# EAGLE design SparkFun_TensorFlow_Ambiq_Apollo3 (EAGLE 9.4.0)

## Sheet 1 of 2
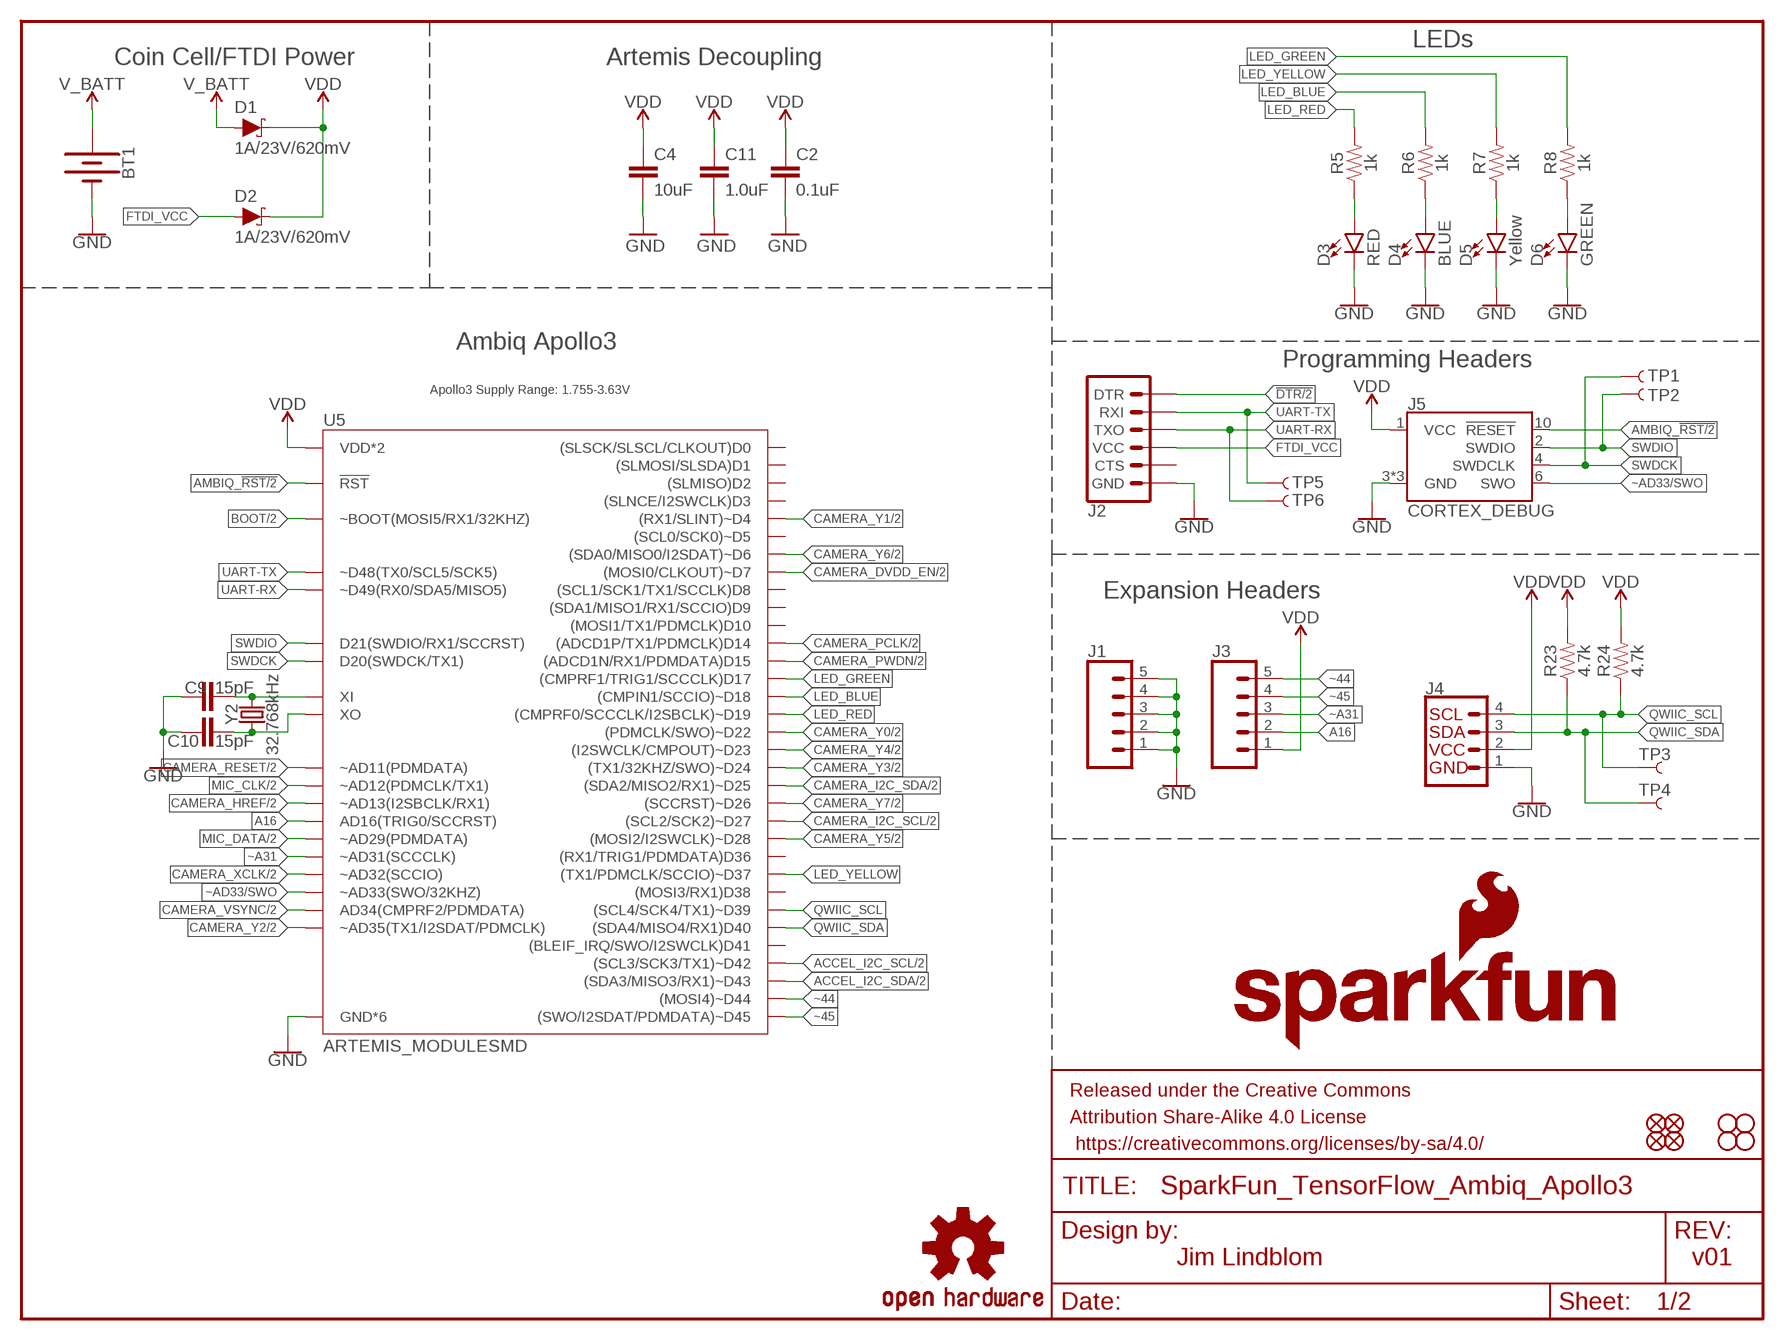
[diagram p0: schematic, sheet 1]

### Parts
BT1  BATTERY-20MM_SMD_4LEGS_OVERPASTE_INNER  [BATTCON_20MM_4LEGS_OVERPASTE_INNER]
C2  0.1uF  0.1UF-0402T-16V-10%  [0402-TIGHT]
C4  10uF  10UF-0603-6.3V-20%  [0603]
C9  15pF  15PF-0402-TIGHT-50V-5%  [0402-TIGHT]
C10  15pF  15PF-0402-TIGHT-50V-5%  [0402-TIGHT]
C11  1.0uF  1.0UF-0402T-16V-10%  [0402-TIGHT]
D1  1A/23V/620mV  DIODE-SCHOTTKY-BAT20J  [SOD-323]
D2  1A/23V/620mV  DIODE-SCHOTTKY-BAT20J  [SOD-323]
D3  RED  LED-RED0603  [LED-0603]
D4  BLUE  LED-BLUE0603  [LED-0603]
D5  Yellow  LED-YELLOW0603  [LED-0603]
D6  GREEN  LED-GREEN0603  [LED-0603]
FD1  FIDUCIAL1X2  [FIDUCIAL-1X2]
FD2  FIDUCIAL1X2  [FIDUCIAL-1X2]
FD3  FIDUCIAL1X2  [FIDUCIAL-1X2]
FD4  FIDUCIAL1X2  [FIDUCIAL-1X2]
FRAME1  FRAME-LETTER  [CREATIVE_COMMONS]
H1  STAND-OFF  [STAND-OFF]
H2  STAND-OFF  [STAND-OFF]
H3  STAND-OFF  [STAND-OFF]
H4  STAND-OFF  [STAND-OFF]
J1  CONN_05NO_SILK  [1X05_NO_SILK]
J2  6_PIN_SERIAL_TARGETSMD  [1X06-SMD_RA_MALE]
J3  CONN_05NO_SILK  [1X05_NO_SILK]
J4  QWIIC_CONNECTORJS-1MM  [JST04_1MM_RA]
J5  CORTEX_DEBUG  CORTEX_DEBUG_MINIMUM_PTH_NS  [2X5-PTH-1.27MM-NO_SILK]
LOGO1  SFE_LOGO_NAME_FLAME.1_INCH  [SFE_LOGO_NAME_FLAME_.1]
LOGO2  OSHW-LOGOS  [OSHW-LOGO-S]
R5  1k  1KOHM-0603-1/10W-1%  [0603]
R6  1k  1KOHM-0603-1/10W-1%  [0603]
R7  1k  1KOHM-0603-1/10W-1%  [0603]
R8  1k  1KOHM-0603-1/10W-1%  [0603]
R23  4.7k  4.7KOHM-0603-1/10W-1%  [0603]
R24  4.7k  4.7KOHM-0603-1/10W-1%  [0603]
TP1  TEST-POINT3X5  [PAD.03X.05]
TP2  TEST-POINT3X5  [PAD.03X.05]
TP3  TEST-POINT3X5  [PAD.03X.05]
TP4  TEST-POINT3X5  [PAD.03X.05]
TP5  TEST-POINT3X5  [PAD.03X.05]
TP6  TEST-POINT3X5  [PAD.03X.05]
U5  ARTEMIS_MODULESMD  [ARTEMIS_FP]
Y2  32.768kHz  CRYSTAL-32.768KHZSMD-3.2X1.5  [CRYSTAL-SMD-3.2X1.5MM]

### Nets
!DTR: J2.1(DTR) ; also sheet 2
A16: J3.2 U5.AD16(AD16(TRIG0/SCCRST))
ACCEL_I2C_SCL: U5.~D42((SCL3/SCK3/TX1)~D42) ; also sheet 2
ACCEL_I2C_SDA: U5.~D43((SDA3/MISO3/RX1)~D43) ; also sheet 2
AMBIQ_!RST: J5.10(!RESET) U5.~RST(!RST) ; also sheet 2
BOOT: U5.BOOT(~BOOT(MOSI5/RX1/32KHZ)) ; also sheet 2
CAMERA_DVDD_EN: U5.D7((MOSI0/CLKOUT)~D7) ; also sheet 2
CAMERA_HREF: U5.~AD13(~AD13(I2SBCLK/RX1)) ; also sheet 2
CAMERA_I2C_SCL: U5.~D27((SCL2/SCK2)~D27) ; also sheet 2
CAMERA_I2C_SDA: U5.~D25((SDA2/MISO2/RX1)~D25) ; also sheet 2
CAMERA_PCLK: U5.D14((ADCD1P/TX1/PDMCLK)D14) ; also sheet 2
CAMERA_PWDN: U5.D15((ADCD1N/RX1/PDMDATA)D15) ; also sheet 2
CAMERA_RESET: U5.~AD11(~AD11(PDMDATA)) ; also sheet 2
CAMERA_VSYNC: U5.AD34(AD34(CMPRF2/PDMDATA)) ; also sheet 2
CAMERA_XCLK: U5.~AD32(~AD32(SCCIO)) ; also sheet 2
CAMERA_Y0: U5.~D22((PDMCLK/SWO)~D22) ; also sheet 2
CAMERA_Y1: U5.~D4((RX1/SLINT)~D4) ; also sheet 2
CAMERA_Y2: U5.~AD35(~AD35(TX1/I2SDAT/PDMCLK)) ; also sheet 2
CAMERA_Y3: U5.~D24((TX1/32KHZ/SWO)~D24) ; also sheet 2
CAMERA_Y4: U5.~D23((I2SWCLK/CMPOUT)~D23) ; also sheet 2
CAMERA_Y5: U5.~D28((MOSI2/I2SWCLK)~D28) ; also sheet 2
CAMERA_Y6: U5.~D6((SDA0/MISO0/I2SDAT)~D6) ; also sheet 2
CAMERA_Y7: U5.~D26((SCCRST)~D26) ; also sheet 2
FTDI_VCC: D2.A J2.4(VCC)
GND: BT1.2(-) C2.1 C4.2 C9.1 C10.1 C11.2 D3.C D4.C D5.C D6.C J1.1 J1.2 J1.3 J1.4 J1.5 J2.6(GND) J4.1 J5.3(GND) J5.5(GND) J5.9(GND) U5.GND@1(GND*6) U5.GND@22(GND*6) U5.GND@38(GND*6) U5.GND@39(GND*6) U5.GND@47(GND*6) U5.GND@59(GND*6) ; also sheet 2
LED_BLUE: R6.2 U5.~D18((CMPIN1/SCCIO)~D18)
LED_GREEN: R8.2 U5.D17((CMPRF1/TRIG1/SCCCLK)D17)
LED_RED: R5.2 U5.~D19((CMPRF0/SCCCLK/I2SBCLK)~D19)
LED_YELLOW: R7.2 U5.~D37((TX1/PDMCLK/SCCIO)~D37)
MIC_CLK: U5.~AD12(~AD12(PDMCLK/TX1)) ; also sheet 2
MIC_DATA: U5.~AD29(~AD29(PDMDATA)) ; also sheet 2
N$2: C9.2 U5.XI Y2.P$2
N$5: D4.A R6.1
N$6: D3.A R5.1
N$7: D5.A R7.1
N$8: D6.A R8.1
QWIIC_SCL: J4.4 R24.1 TP3.P$1 U5.~D39((SCL4/SCK4/TX1)~D39)
QWIIC_SDA: J4.3 R23.1 TP4.P$1 U5.D40((SDA4/MISO4/RX1)D40)
SWDCK: J5.4(SWDCLK) TP1.P$1 U5.SWDCK(D20(SWDCK/TX1))
SWDIO: J5.2(SWDIO) TP2.P$1 U5.SWDIO(D21(SWDIO/RX1/SCCRST))
UART-RX: J2.3(TXO) TP6.P$1 U5.RXI-0(~D49(RX0/SDA5/MISO5))
UART-TX: J2.2(RXI) TP5.P$1 U5.TXO-0(~D48(TX0/SCL5/SCK5))
V_BATT: BT1.1(+) D1.A
VDD: C2.2 C4.1 C11.1 D1.C D2.C J3.1 J4.2 J5.1(VCC) R23.2 R24.2 U5.VDD@36(VDD*2) U5.VDD@37(VDD*2) ; also sheet 2
X0: C10.2 U5.XO Y2.P$1
~44: J3.5 U5.~D44((MOSI4)~D44)
~45: J3.4 U5.~D45((SWO/I2SDAT/PDMDATA)~D45)
~A31: J3.3 U5.~AD31(~AD31(SCCCLK))
~AD33/SWO: J5.6(SWO) U5.~AD33/SWO(~AD33(SWO/32KHZ))
Unconnected: J2.5(CTS) U5.D0((SLSCK/SLSCL/CLKOUT)D0) U5.D1((SLMOSI/SLSDA)D1) U5.D2((SLMISO)D2) U5.D3((SLNCE/I2SWCLK)D3) U5.D8((SCL1/SCK1/TX1/SCCLK)D8) U5.D9((SDA1/MISO1/RX1/SCCIO)D9) U5.D10((MOSI1/TX1/PDMCLK)D10) U5.D36((RX1/TRIG1/PDMDATA)D36) U5.D38((MOSI3/RX1)D38) U5.D41((BLEIF_IRQ/SWO/I2SWCLK)D41) U5.~D5((SCL0/SCK0)~D5)

### Notes on the sheet
- LEDs
- Coin Cell/FTDI Power | Artemis Decoupling
- Ambiq Apollo3
- Programming Headers
- Apollo3 Supply Range: 1.755-3.63V
- Expansion Headers
- Jim Lindblom | v01

## Sheet 2 of 2
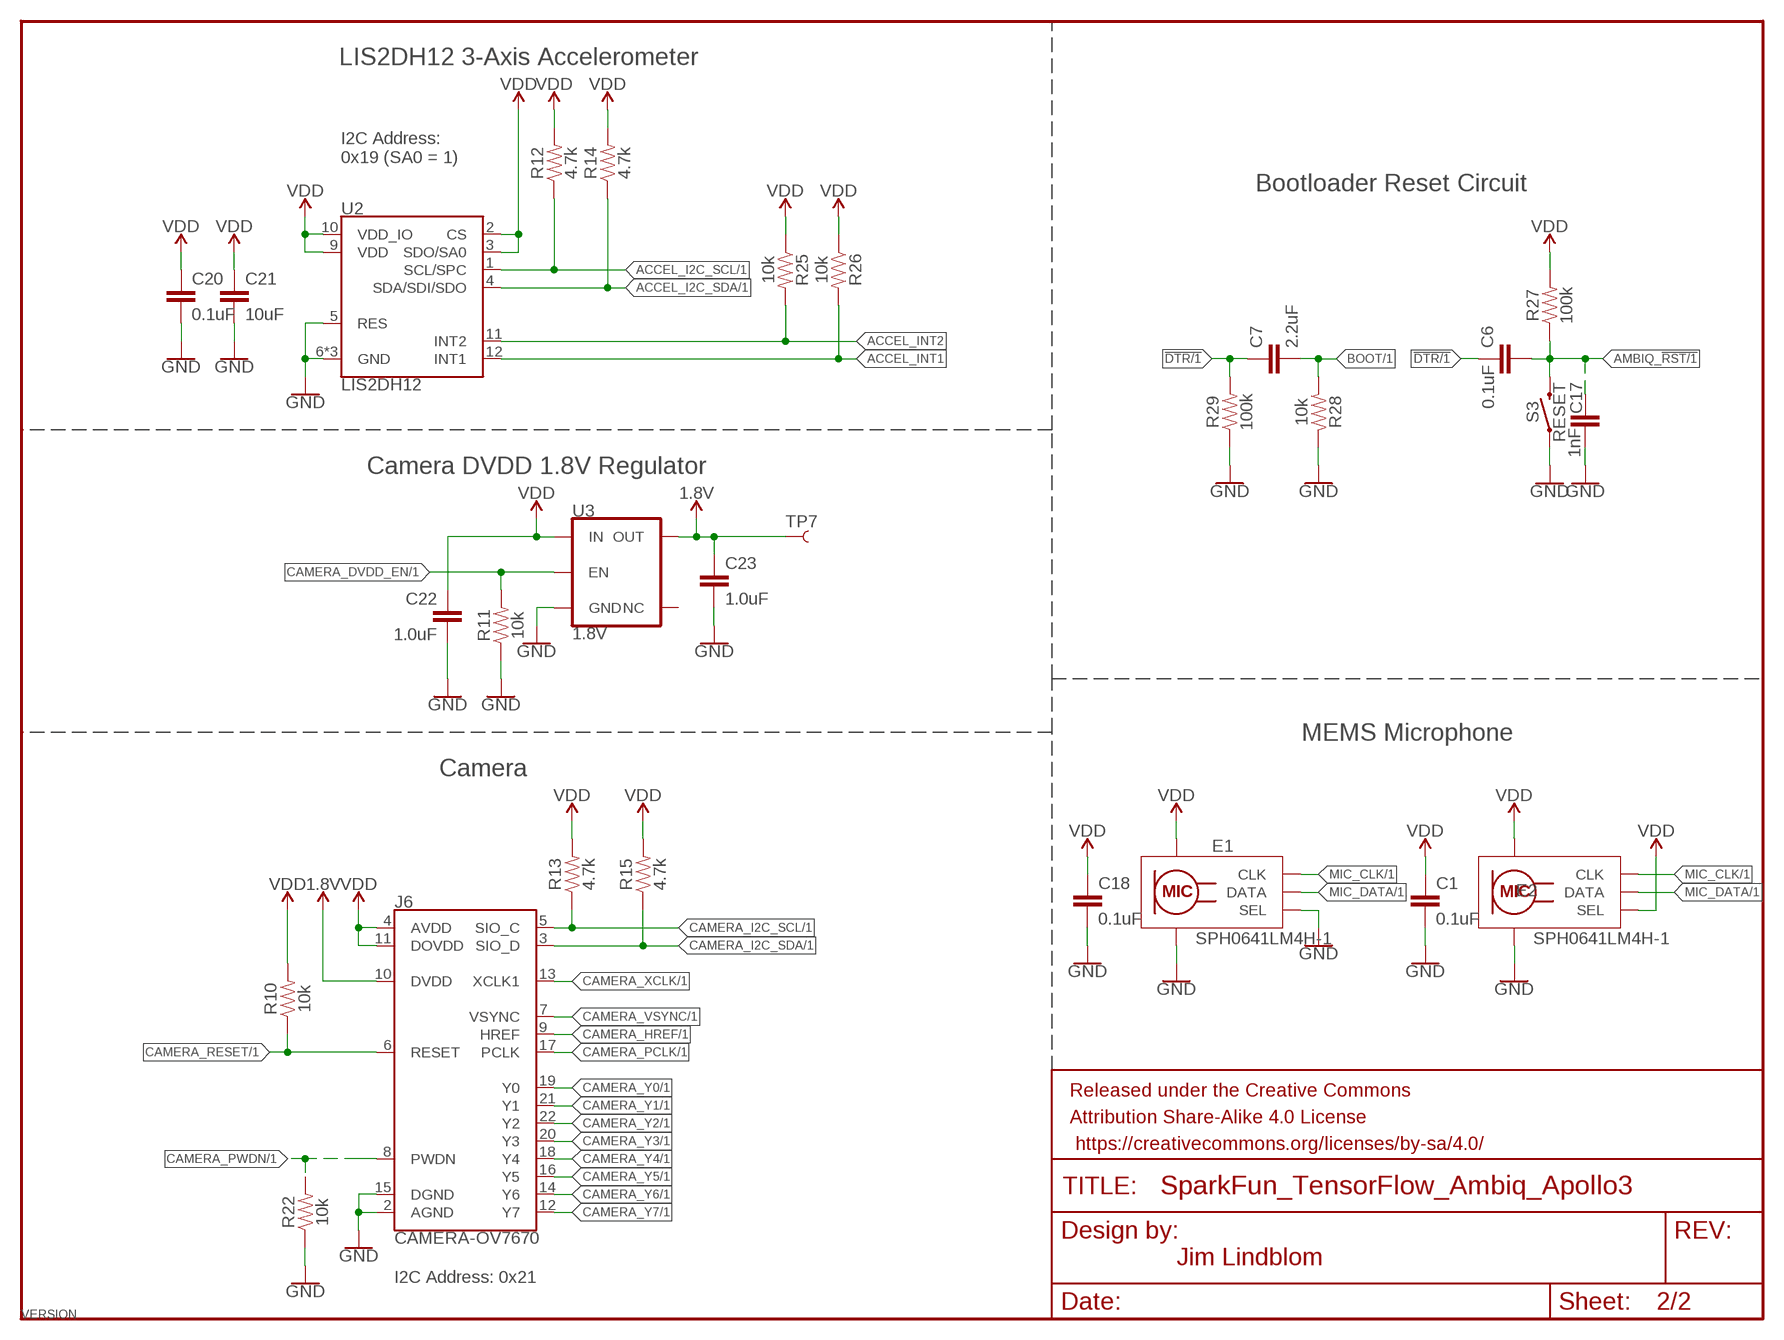
[diagram p1: schematic, sheet 2]

### Parts
C1  0.1uF  0.1UF-0402-TIGHT-16V-10%  [0402-TIGHT]
C6  0.1uF  0.1UF-0603-25V-5%  [0603]
C7  2.2uF  2.2UF-0603-10V-20%  [0603]
C17  1nF  1.0NF/1000PF-0603-50V-10%  [0603]
C18  0.1uF  0.1UF-0402-TIGHT-16V-10%  [0402-TIGHT]
C20  0.1uF  0.1UF-0402-TIGHT-16V-10%  [0402-TIGHT]
C21  10uF  10UF-0603-6.3V-20%  [0603]
C22  1.0uF  1.0UF-0402-TIGHT-16V-10%  [0402-TIGHT]
C23  1.0uF  1.0UF-0402-TIGHT-16V-10%  [0402-TIGHT]
E1  SPH0641LM4H-1  SPH0641LM4H-1_MICROPHONE  [SPH0641LM4H-1_MICROPHONE]
E2  SPH0641LM4H-1  SPH0641LM4H-1_MICROPHONE  [SPH0641LM4H-1_MICROPHONE]
FRAME2  FRAME-LETTERNO_PACKAGE  [DUMMY]
J6  CAMERA-OV7670  [FPC-24-AMPHENOL-SFV24R-1STE1HLF]
R10  10k  10KOHM-0402T-1/16W-1%  [0402-TIGHT]
R11  10k  10KOHM-0402T-1/16W-1%  [0402-TIGHT]
R12  4.7k  4.7KOHM-0603-1/10W-1%  [0603]
R13  4.7k  4.7KOHM-0603-1/10W-1%  [0603]
R14  4.7k  4.7KOHM-0603-1/10W-1%  [0603]
R15  4.7k  4.7KOHM-0603-1/10W-1%  [0603]
R22  10k  10KOHM-0402T-1/16W-1%  [0402-TIGHT]
R25  10k  10KOHM-0402T-1/16W-1%  [0402-TIGHT]
R26  10k  10KOHM-0402T-1/16W-1%  [0402-TIGHT]
R27  100k  100KOHM-0603-1/10W-1%  [0603]
R28  10k  10KOHM-0603-1/10W-1%  [0603]
R29  100k  100KOHM-0603-1/10W-1%  [0603]
S3  RESET  MOMENTARY-SWITCH-SPST-SMD-5.2MM-TALL  [TACTILE_SWITCH_SMD_5.2MM]
TP7  TEST-POINT3X5  [PAD.03X.05]
U2  LIS2DH12  [LGA-12-LISDH12]
U3  1.8V  V_REG_AP2127K-1.8V  [SOT23-5]

### Nets
1.8V: C23.1 J6.10(DVDD) TP7.P$1 U3.5(OUT)
!DTR: C6.1 C7.1 R29.2 ; also sheet 1
ACCEL_I2C_SCL: R12.1 U2.1(SCL/SPC) ; also sheet 1
ACCEL_I2C_SDA: R14.1 U2.4(SDA/SDI/SDO) ; also sheet 1
ACCEL_INT1: R26.2 U2.12(INT1)
ACCEL_INT2: R25.2 U2.11(INT2)
AMBIQ_!RST: C6.2 C17.1 R27.1 S3.3 ; also sheet 1
BOOT: C7.2 R28.2 ; also sheet 1
CAMERA_DVDD_EN: R11.2 U3.3(EN) ; also sheet 1
CAMERA_HREF: J6.9(HREF) ; also sheet 1
CAMERA_I2C_SCL: J6.5(SIO_C) R13.1 ; also sheet 1
CAMERA_I2C_SDA: J6.3(SIO_D) R15.1 ; also sheet 1
CAMERA_PCLK: J6.17(PCLK) ; also sheet 1
CAMERA_PWDN: J6.8(PWDN) R22.2 ; also sheet 1
CAMERA_RESET: J6.6(RESET) R10.1 ; also sheet 1
CAMERA_VSYNC: J6.7(VSYNC) ; also sheet 1
CAMERA_XCLK: J6.13(XCLK1) ; also sheet 1
CAMERA_Y0: J6.19(Y0) ; also sheet 1
CAMERA_Y1: J6.21(Y1) ; also sheet 1
CAMERA_Y2: J6.22(Y2) ; also sheet 1
CAMERA_Y3: J6.20(Y3) ; also sheet 1
CAMERA_Y4: J6.18(Y4) ; also sheet 1
CAMERA_Y5: J6.16(Y5) ; also sheet 1
CAMERA_Y6: J6.14(Y6) ; also sheet 1
CAMERA_Y7: J6.12(Y7) ; also sheet 1
GND: C1.2 C17.2 C18.2 C20.2 C21.2 C22.2 C23.2 E1.2(SEL) E1.3(GND) E1.6(GND) E1.7(GND) E1.8(GND) E2.3(GND) E2.6(GND) E2.7(GND) E2.8(GND) J6.2(AGND) J6.15(DGND) R11.1 R22.1 R28.1 R29.1 S3.1 U2.5(RES) U2.6(GND) U2.7(GND) U2.8(GND) U3.2(GND) ; also sheet 1
MIC_CLK: E1.4(CLK) E2.4(CLK) ; also sheet 1
MIC_DATA: E1.1(DATA) E2.1(DATA) ; also sheet 1
VDD: C1.1 C18.1 C20.1 C21.1 C22.1 E1.5(VDD) E2.2(SEL) E2.5(VDD) J6.4(AVDD) J6.11(DOVDD) R10.2 R12.2 R13.2 R14.2 R15.2 R25.1 R26.1 R27.2 U2.2(CS) U2.3(SDO/SA0) U2.9(VDD) U2.10(VDD_IO) U3.1(IN) ; also sheet 1
Unconnected: J6.MNT1@0(MNT1) J6.MNT1@1(MNT1) J6.MNT2@0(MNT2) J6.MNT2@1(MNT2) U3.4(NC)

### Notes on the sheet
- LIS2DH12 3-Axis Accelerometer
- I2C Address:
  0x19 (SA0 = 1)
- Bootloader Reset Circuit
- Camera DVDD 1.8V Regulator
- MEMS Microphone
- Camera
- Jim Lindblom
- I2C Address: 0x21

## Library data of the parts
BT1 = SparkFun-Batteries:BATTERY: Battery - Single Cell A variety of battery chemistries, sizes, and footprints. Device List: 20MM_PTH - Coin Cell Battery Holder - 20mm (PTH) <https://www.sparkfun.com/products/783> 20MM_PTH_KIT- Coin Cell battery Holder - 20 mm (PTH) <http://www.sparkfun.com/products/783>kit version with special mask 6.8MM_PTH - Coin Cell Battery Holder - 6.8MM(SMD) <https://www.digikey.com/product-detail/en/seiko-instruments/MS621FE-FL11E/728-1057-ND/1889208?WT.srch=1&gclid=CNOQ5a6LzdQCFZS2wAodXCkE0g> 12MM_SMD - Coin Cell Battery Holder - 12mm (SMD) <https://www.sparkfun.com/products/10592> 12MM_PTH - Coin Cell Battery Holder - 12mm (PTH) <https://www.sparkfun.com/products/7948> 20MM_SMD - 20mm Coin Cell Battery Holder (SMD) (2 legs) Used on the Big Time Watch Kit <https://www.sparkfun.com/products/11734> 20MM_SMD_4LEGS - Coin Cell Battery Holder - 20mm (SMD) <https://www.sparkfun.com/products/11892> 20MM_SMD_4LEGS_OVERPASTE - Coin Cell Battery Holder - 20mm (SMD) <https://www.sparkfun.com/products/11892> (Over-paste on the legs) 24.5MM_PTH - Coin Cell Battery Holder - 24.5mm (PTH) <https://www.sparkfun.com/products/8863> 9V - 9V Battery Holder - PC Mount Used on the SparkFun SparkPunk Sound Kit <https://www.sparkfun.com/products/11177> and SparkFun SparkPunk Sequencer Kit <https://www.sparkfun.com/products/12707> 18650 - Battery Holder - 18650 (PTH) <https://www.sparkfun.com/products/13113> AA - Battery Holder - 1xAA (PTH) <https://www.sparkfun.com/products/7949> AAA - Battery Holder - 1xAAA (PTH) <https://www.sparkfun.com/products/12718> AA_KIT - Battery Holder - 1xAA (PTH) <https://www.sparkfun.com/products/7949> Special kit package - pads only have exposed copper on one side of the board. AAA_KIT - Battery Holder - 1xAAA (PTH) <https://www.sparkfun.com/products/12718> Special kit package - pads only have exposed copper on one side of the board.
C1 C18 C20 = ambiq:0.1UF: 0.1µF ceramic capacitors A capacitor is a passive two-terminal electrical component used to store electrical energy temporarily in an electric field.; PROD_ID: CAP-12416
C2 = SparkFun-Capacitors:0.1UF: 0.1µF ceramic capacitors A capacitor is a passive two-terminal electrical component used to store electrical energy temporarily in an electric field.; PROD_ID: CAP-12416
C4 C21 = SparkFun-Capacitors:10UF: 10.0µF ceramic capacitors A capacitor is a passive two-terminal electrical component used to store electrical energy temporarily in an electric field.; PROD_ID: CAP-11015
C6 = SparkFun-Capacitors:0.1UF: 0.1µF ceramic capacitors A capacitor is a passive two-terminal electrical component used to store electrical energy temporarily in an electric field.; PROD_ID: CAP-08604
C7 = SparkFun-Capacitors:2.2UF: 2.2µF ceramic capacitors A capacitor is a passive two-terminal electrical component used to store electrical energy temporarily in an electric field.; PROD_ID: CAP-07888
C9 C10 = ambiq:15PF: 15pF ceramic capacitors A capacitor is a passive two-terminal electrical component used to store electrical energy temporarily in an electric field.; PROD_ID: CAP-13063
C11 = SparkFun-Capacitors:1.0UF: 1µF ceramic capacitors A capacitor is a passive two-terminal electrical component used to store electrical energy temporarily in an electric field.; PROD_ID: CAP-12417
C17 = SparkFun-Capacitors:1.0NF/1000PF: 1nF/1,000pF ceramic capacitors A capacitor is a passive two-terminal electrical component used to store electrical energy temporarily in an electric field.; PROD_ID: CAP-07886
C22 C23 = ambiq:1.0UF: 1µF ceramic capacitors A capacitor is a passive two-terminal electrical component used to store electrical energy temporarily in an electric field.; PROD_ID: CAP-12417
D1 D2 = SparkFun-DiscreteSemi:DIODE-SCHOTTKY: Schottky diode A Schottky diode is a semiconductor diode which has a low forward voltage drop and a very fast switching action.; PROD_ID: DIO-11623
D3 = SparkFun-LED:LED-RED: Red SMD LED Used in manufacturing of most products at SparkFun Packages: 0603 - SMD 0603 package [Product Link] <http://docs.avagotech.com/docs/AV02-0551EN> 0603 SMART - SMD 0603 SMART package ( more efficient and expensive)[Product Link] <http://www.osram-os.com/Graphics/XPic2/00077099_0.pdf> 1206 - SMD1206 package [Product Link] <https://www.sparkfun.com/datasheets/DevTools/LilyPad/Q150OVS4.pdff> SparkFun Products: Pro Mini 328 -5V <https://www.sparkfun.com/products/821> RedBoard <https://www.sparkfun.com/products/12757> IOIO-OTG <https://www.sparkfun.com/products/13613>; PROD_ID: DIO-00819
D4 = SparkFun-LED:LED-BLUE: Blue SMD LED Used in manufacturing of various products at SparkFun Packages: 0603 - SMD 0603 package [Product Link] <http://www.digikey.com/product-detail/en/SMLE12BC7TT86/511-1589-2-ND/1641808> 1206 - SMD1206 package [Product Link] <http://www.digikey.com/product-detail/en/lite-on-inc/LTST-C150TBKT/160-1643-1-ND/573584> SparkFun Products: ESP8266 Thing-Dev Board <https://www.sparkfun.com/products/13711> RedBoard <https://www.sparkfun.com/products/12757>; PROD_ID: DIO-08575
D5 = SparkFun-LED:LED-YELLOW: Yellow SMD LED Used in manufacturing several products at SparkFun. Packages: 0603 - SMD 0603 package[Product Link] <http://www.kingbrightusa.com/product.asp?catalog_name=LED&product_id=APT1608SYCK> 0603 -SMART - SMART SMD 0603 package (more efficient/more expensive) [Product Link] <http://www.osram-os.com/osram_os/en/products/product-catalog/led-light-emitting-diodes/smartled-0603/ly-l29k/index.jsp> LilyPad - SMD1206 package[Product Datasheet] <https://www.sparkfun.com/datasheets/DevTools/LilyPad/Q150YUS4.pdf> SparkFun Products: Blynk Board <https://www.sparkfun.com/products/13794> IOIO-OTG <https://www.sparkfun.com/products/13613> XBee Explorer Serial <https://www.sparkfun.com/products/13225>; PROD_ID: DIO-09003
D6 = SparkFun-LED:LED-GREEN: Green SMD LED Used in manufacturing of various products at SparkFun Packages: 0603 - SMD 0603 package [Product Link] <http://www.futureelectronics.com/en/technologies/semiconductors/optoelectronics/leds/Pages/9894312-LTST-C190GKT.aspx?CrossPart=HSMG-C190&IM=0> LilyPad 1206 - SMD1206 LilyPad package [Product Link] <http://www.futureelectronics.com/en/Technologies/Product.aspx?ProductID=IN150NGHARVATEKCORPORATION2049943&IM=0> 1206 - SMD1206 package [Product Link] <http://www.futureelectronics.com/en/technologies/semiconductors/optoelectronics/leds/Pages/8315665-LTST-C150KGKT.aspx?IM=0> 1206 Bottom Mount -SMD 1206 Bottom Mount [Product Link] <http://www.digikey.com/product-detail/en/lite-on-inc/LTST-C230KGKT/160-1456-1-ND/386854> SparkFun Products: Pro Mini 328 -5V <https://www.sparkfun.com/products/821> RedBoard <https://www.sparkfun.com/products/12757> MP3 Trigger <https://www.sparkfun.com/products/13720> Makey Makey <https://www.sparkfun.com/products/11076>; PROD_ID: DIO-00821
E1 E2 = SparkFun-Sensors:SPH0641LM4H-1_MICROPHONE: SPH0641LM4H-1 Microphone A miniature, high-performance, low power, bottom port silicon digital microphone with a single bit PDM output.; PROD_ID: IC-14361
FD1-FD4 = SparkFun-Aesthetics:FIDUCIAL: Fiducial Alignment Points Point-of-reference for pick-and-place machines and other optical instruments.
FRAME1 = SparkFun-Aesthetics:FRAME-LETTER: Schematic Frame - Letter Standard 8.5x11 US Letter frame
FRAME2 = SparkFun-Aesthetics:FRAME-LETTER: Schematic Frame - Letter Standard 8.5x11 US Letter frame; DESIGNER: Nobody; VERSION: x01
H1-H4 = SparkFun-Hardware:STAND-OFF: Stand Off Drill holes for mechanically mounting via screws, standoffs, etc. Note: Use the keepout ring to avoid running the screw head into surrounding components. Variant Overviews STAND-OFF - Mechanical footprint for a #4 phillips button head screw. STAND-OFF-TIGHT - Mechanical footprint for a #4 phillips button head screw, Example SparkFun Products Screw - Phillips Head (1/4", 4-40, 10 pack) <https://www.sparkfun.com/products/10453> (PRT-10453) Screw - Phillips Head (1/2", 4-40, 10 pack) <https://www.sparkfun.com/products/10452> (PRT-10452) Screw - Phillips Head (3/4", 4-40, 10 pack) <https://www.sparkfun.com/products/10451> (PRT-10451) Screw - Phillips Head (1", 4-40, 10 pack) <https://www.sparkfun.com/products/10450> (PRT-10450)
J1 J3 = SparkFun-Connectors:CONN_05: Multi connection point. Often used as Generic Header-pin footprint for 0.1 inch spaced/style header connections On any of the 0.1 inch spaced packages, you can populate with these: Break Away Headers - Straight <https://www.sparkfun.com/products/116> (PRT-00116) Break Away Male Headers - Right Angle <https://www.sparkfun.com/products/553> (PRT-00553) Female Headers <https://www.sparkfun.com/products/115> (PRT-00115) Break Away Headers - Machine Pin <https://www.sparkfun.com/products/117> (PRT-00117) Break Away Female Headers - Swiss Machine Pin <https://www.sparkfun.com/products/743> (PRT-00743) For SCREWTERMINALS and SPRING TERMINALS visit here: Screw Terimnals on SparkFun.com <https://www.sparkfun.com/search/results?term=Screw+Terminals> (5mm/3.5mm/2.54mm spacing) This device is also useful as a general connection point to wire up your design to another part of your project. Our various solder wires solder well into these plated through hole pads. Hook-Up Wire - Assortment (Stranded, 22 AWG) <https://www.sparkfun.com/products/11375> (PRT-11375) Hook-Up Wire - Assortment (Solid Core, 22 AWG) <https://www.sparkfun.com/products/11367> (PRT-11367) View the entire wire category on our website here <https://www.sparkfun.com/categories/141> Special notes: Molex polarized connector foot print use with SKU : PRT-08231 with associated crimp pins and housings. 1MM SMD Version SKU: PRT-10208
J2 = SparkFun-Connectors:6_PIN_SERIAL_TARGET: 6-pin header connection for use with the "FTDI BASIC" pinout - TARGET SIDE. Also known as "Arduino Serial Program Header". It is used to mate with our FTDI Basic serial programmers using the Arduino IDE. Note, this device has "TARGET" in the name. It is intended to be used on a design that contains a target micro-controller that you wish to program. The "sister" device, named "CABLE" is inteneded to be used on a design that usually lives on the end of your USB cable and prvides the converter chip (FTDI232 or FTDI231x) to commnicate serial RX/TX. You can populate with some of these: Break Away Headers - Straight <https://www.sparkfun.com/products/116> (PRT-00116) For reference (or to suit your programming needs) check out these designs: SparkFun FTDI Basic Breakout - 5V <https://www.sparkfun.com/products/9716> (DEV-09716) SparkFun FTDI Basic Breakout - 3.3V <https://www.sparkfun.com/products/9873> (DEV-09873) SparkFun FTDI SmartBasic <https://www.sparkfun.com/products/12935> (DEV-12935) SparkFun Beefy 3 - FTDI Basic Breakout <https://www.sparkfun.com/products/13746> (DEV-13746); PROD_ID: CONN-08971
J4 = SparkFun-Connectors:QWIIC_CONNECTOR: SparkFun I2C Standard Qwiic Connector An SMD 1mm pitch JST connector makes it easy and quick (get it? Qwiic?) to connect I2C devices to each other. The Qwiic system <http://www.sparkfun.com/qwiic> enables fast and solderless connection between popular platforms and various sensors and actuators. We carry 200mm <https://www.sparkfun.com/products/14204>, 100mm <https://www.sparkfun.com/products/14205>, 50mm <https://www.sparkfun.com/products/14206>, and breadboard friendly <https://www.sparkfun.com/products/14207> Qwiic cables. We also offer 10 pcs strips <https://www.sparkfun.com/products/14323> the SMD connectors.; PROD_ID: CONN-13694
J5 = SparkFun-Connectors:CORTEX_DEBUG_MINIMUM: Cortex Debug Connector - 10 pin Supports JTAG debug, Serial Wire debug, and Serial Wire Viewer. PTH and SMD connector options available. General Connector Information <http://infocenter.arm.com/help/topic/com.arm.doc.faqs/attached/13634/cortex_debug_connectors.pdf> Products: PTH Connector <http://www.digikey.com/product-detail/en/cnc-tech/3220-10-0100-00/1175-1627-ND/3883661> -via Digi-Key SparkFun PSoc <https://www.sparkfun.com/products/13229> SparkFun T <https://www.sparkfun.com/products/13810>
J6 = SparkFun-Connectors:CAMERA-OV7670; DIGIKEY: 609-4320-2-ND; PROD_ID: CONN-14233
LOGO1 = SparkFun-Aesthetics:SFE_LOGO_NAME_FLAME: SparkFun Font Logo w/ Flame This is the SparkFun full logo. The logo on the schematic will always be the same size; the package variant is the height of the flame part of the logo. Default layer for the logo on the board is tSilk.
LOGO2 = SparkFun-Aesthetics:OSHW-LOGO: Open-Source Hardware (OSHW) Logo This logo indicates the piece of hardware it is found on incorporates a OSHW license and/or adheres to the definition of open source hardware found here: http://freedomdefined.org/OSHW
R5-R8 = SparkFun-Resistors:1KOHM: 1kΩ resistor A resistor is a passive two-terminal electrical component that implements electrical resistance as a circuit element. Resistors act to reduce current flow, and, at the same time, act to lower voltage levels within circuits. - Wikipedia; PROD_ID: RES-07856
R10 R11 R22 R25 R26 = SparkFun-Resistors:10KOHM: 10kΩ resistor A resistor is a passive two-terminal electrical component that implements electrical resistance as a circuit element. Resistors act to reduce current flow, and, at the same time, act to lower voltage levels within circuits. - Wikipedia; PROD_ID: RES-14241
R12-R15 R23 R24 = SparkFun-Resistors:4.7KOHM: 4.7kΩ resistor A resistor is a passive two-terminal electrical component that implements electrical resistance as a circuit element. Resistors act to reduce current flow, and, at the same time, act to lower voltage levels within circuits. - Wikipedia; PROD_ID: RES-07857
R27 R29 = SparkFun-Resistors:100KOHM: 100kΩ resistor A resistor is a passive two-terminal electrical component that implements electrical resistance as a circuit element. Resistors act to reduce current flow, and, at the same time, act to lower voltage levels within circuits. - Wikipedia; PROD_ID: RES-07828
R28 = SparkFun-Resistors:10KOHM: 10kΩ resistor A resistor is a passive two-terminal electrical component that implements electrical resistance as a circuit element. Resistors act to reduce current flow, and, at the same time, act to lower voltage levels within circuits. - Wikipedia; PROD_ID: RES-00824
S3 = SparkFun-Switches:MOMENTARY-SWITCH-SPST: Momentary Switch (Pushbutton) - SPST Normally-open (NO) SPST momentary switches (buttons, pushbuttons). Variants PTH-12MM - 12mm square, through-hole Momentary Pushbutton Switch - 12mm Square <https://www.sparkfun.com/products/9190> (COM-09190) PTH-6.0MM, PTH-6.0MM-KIT - 6.0mm square, through-hole Mini Pushbutton Switch <https://www.sparkfun.com/products/97> (COM-00097) KIT package intended for soldering kit's - only one side of pads' copper is exposed. PTH-RIGHT-ANGLE-KIT - Right-angle, through-hole Right Angle Tactile Button <https://www.sparkfun.com/products/10791> - Used on SparkFun BigTime Watch Kit <https://www.sparkfun.com/products/11734> SMD-12MM - 12mm square, surface-mount Tactile Button - SMD (12mm) <https://www.sparkfun.com/products/12993> (COM-12993) Used on SparkFun PicoBoard <https://www.sparkfun.com/products/11888> SMD-4.5MM - 4.5mm Square Trackball Switch Used on SparkFun Blackberry Trackballer Breakout <https://www.sparkfun.com/products/13169> SMD-4.6MMX2.8MM - 4.60mm x 2.80mm, surface mount Used on SparkFun SAMD21 Mini Breakout <https://www.sparkfun.com/products/13664> SMD-5.2MM, SMD-5.2-REDUNDANT - 5.2mm square, surface-mount Mini Pushbutton Switch - SMD <https://www.sparkfun.com/products/8720> (COM-08720) Used on Arduino Pro Mini <https://www.sparkfun.com/products/11114> REDUNDANT package connects both switch circuits together SMD-6.0X3.5MM - 6.0 x 3.5mm, surface mount Momentary Reset Switch SMD <https://www.sparkfun.com/products/8229> (COM-08229) SMD-6.2MM-TALL - 6.2mm square, surface mount Tactile Button - SMD (6mm) <https://www.sparkfun.com/products/12992> Used on SparkFun Digital Sandbox <https://www.sparkfun.com/products/12651> SMD-RIGHT-ANGLE - Right-angle, surface mount Used on SparkFun Block for Intel® Edison - Arduino <https://www.sparkfun.com/products/13036>; PROD_ID: SWCH-14139
TP1-TP7 = SparkFun-Connectors:TEST-POINT: SparkFun Test Points Bare copper test points for troubleshooting or In-Circuit-Testing. These are used by our Production team for verifying production board runs using pogo-pins on test beds. SparkFun Products: SparkFun LSM9DS1 Breakout <https://www.sparkfun.com/products/13284> SparkFun PSOC <https://www.sparkfun.com/products/13714> SparkFun Load Cell Amplifier <https://www.sparkfun.com/products/13879>
U2 = SparkFun-Sensors:LIS2DH12; DIGIKEY: 497-14851-2-ND; PROD_ID: IC-14229
U3 = SparkFun-IC-Power:V_REG_AP2127: AP2127 - 300mA CMOS LDO Regulator w/ Enable The AP2127 is CMOS process low dropout linear regulator with enable function, the regulator delivers a guaranteed 300mA (min.) continuous load current. Features Output Voltage Accuracy: ±1.5% Output Current: 300mA (Min.) Foldback Short Current Protection: 50mA Enable Function to Turn ON/OFF VOUT Low Dropout Voltage (3.3V): 250mV (Typ.) @IOUT=600mA Excellent Load Regulation: 0.2%/A (Typ.) Excellent Line Regulation: 0.02%/V (Typ.) Low Quiescent Current: 55μA (Typ.) Low Standby Current: 0.01μA (Typ.) Low Output Noise: 50μVRMS PSRR: 100Hz -65dB, 1kHz -65dB OTSD Protection Stable with 1.0μF Flexible Cap: Ceramic, Tantalum and Aluminum Electrolytic Operation Temperature Range: -40°C to 85°C ESD: MM 400V, HBM 4000V; PROD_ID: VREG-14239
U5 = Testing:ARTEMIS_MODULE
Y2 = SparkFun-Clocks:CRYSTAL-32.768KHZ: 32.768kHz Crystal Frequency: 32.768kHz Frequency Stability: ±20ppm Load Capacitance: 12.5pF (PTH-2X6 & SMD-3.2X1.5), 6pF (SMD-2X6) SparkFun Products: SparkFun BigTime Watch Kit <https://www.sparkfun.com/products/11734> SparkFun nRF52832 Breakout <https://www.sparkfun.com/products/13990> SparkFun Real Time Clock Module <https://www.sparkfun.com/products/12708>; PROD_ID: XTAL-13062

## Net classes
0 default: width 0 mm, drill 0 mm
2 usb: width 0.254 mm, drill 0.305 mm, clearance 0.254 mm

## Board
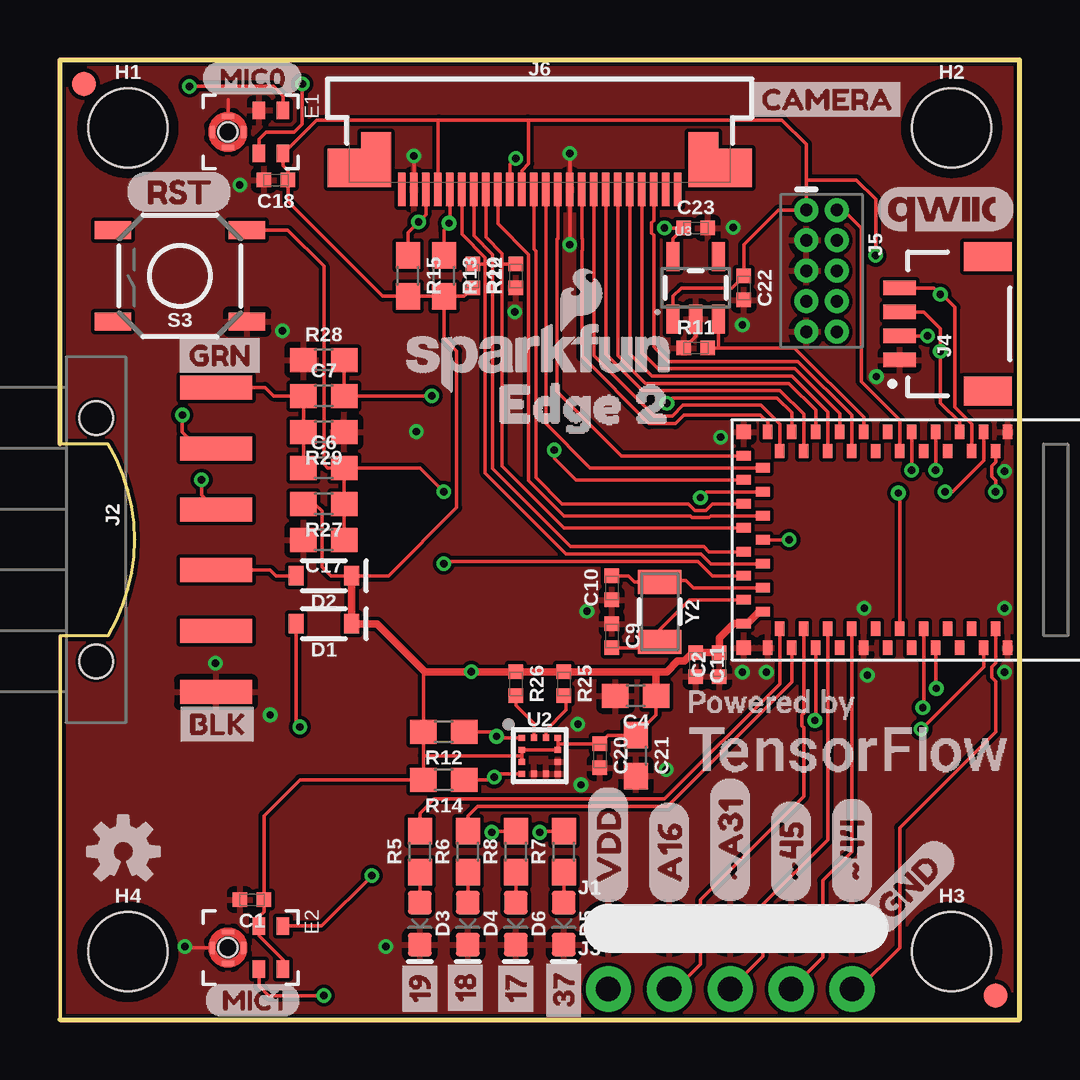
[diagram p2: board, top side]
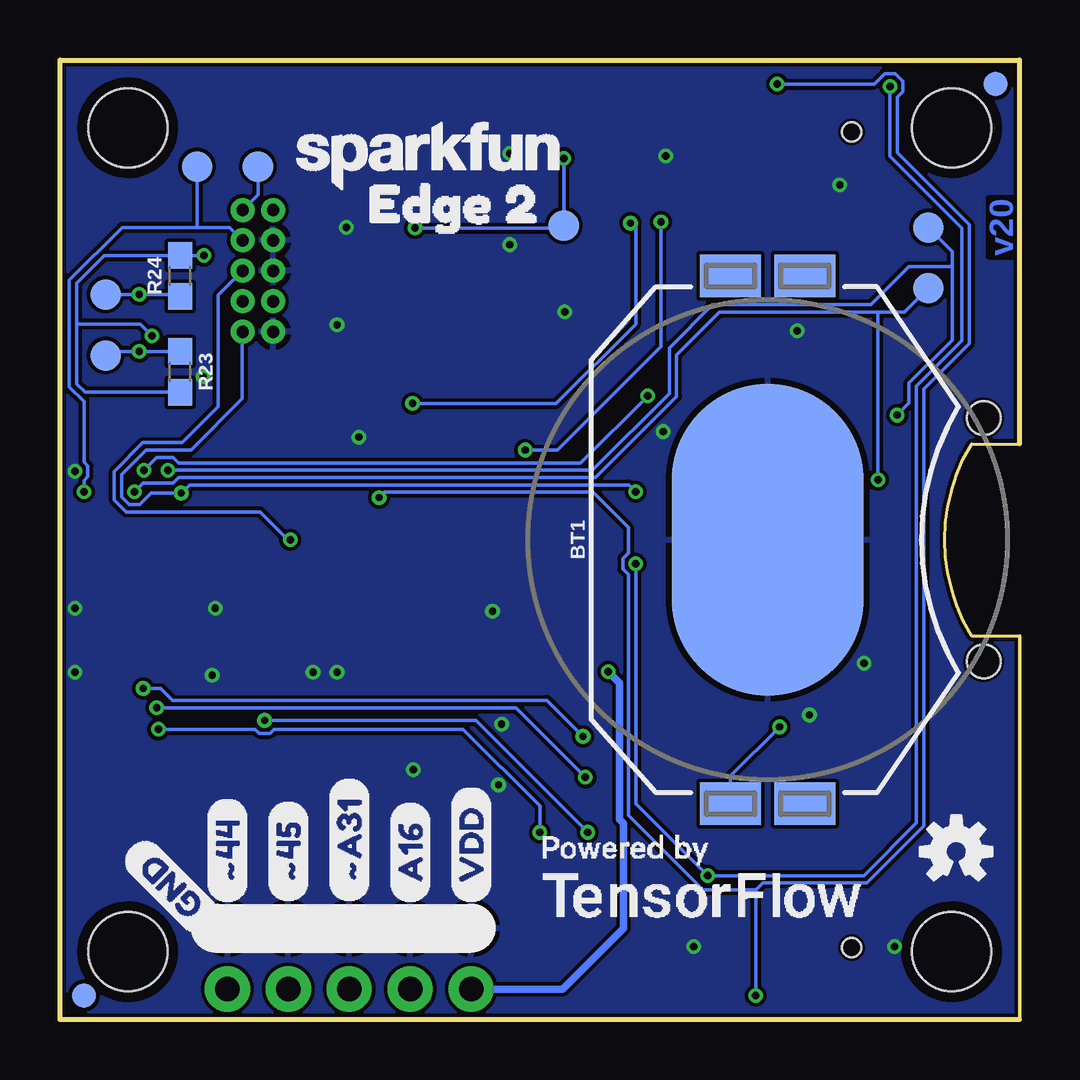
[diagram p3: board, bottom side, seen from below]

Size 40 x 40 mm. Coordinates in mm from the lower left corner, seen from the top.
Outline: 0,0 40,0 40,40 0,40 0,24 2,24 arc-62 2,16 0,16 0,0
Copper layers (1*16): Top 0.035mm / dielectric 1.5mm / Bottom 0.035mm
Design rules "SparkFun-2-layer-PCBWay-LIMIT *": minimum track width 6mil, minimum drill 0.3mm, track to track 6mil, track to pad 6mil, pad to pad 6mil, via to via 6mil, smd to smd 6mil, copper to edge 6mil, drill to drill 6mil, minimum pad ring 6mil, minimum via ring 6mil, stop-mask expansion 4mil, vias tented up to drill 25mil, thermal gap 10mil

### Footprints (pad centres in the part's own frame; a part is rotated, then mirrored left to right if it is on the bottom)
BATTCON_20MM_4LEGS_OVERPASTE_INNER = smd 1.778 x 2.54: 1 -11,1.55; 3 11,1.55; P$1 -11,-1.55; P$2 11,-1.55 | smd 13 x 8: 2 0,0
0402-TIGHT = smd 0.6 x 0.6: 1 -0.5,0; 2 0.5,0
0603 = smd 1.1 x 1: 1 -0.85,0; 2 0.85,0
SOD-323 = smd 0.63 x 0.83: A 1.15,0; C -1.15,0
LED-0603 = smd 1 x 1: A -0.877,0; C 0.877,0
SPH0641LM4H-1_MICROPHONE = smd 0.725 x 0.522: 1 -0.9,1.3; 2 -0.9,0.3; 4 0.9,0.3; 5 0.9,1.3 | smd 0.5 x 0.2: 3 0,-1.65; 8 0,-0.35 | smd 0.2 x 0.5: 6 -0.65,-1; 7 0.65,-1 | hole 0.8: 0,-1
FIDUCIAL-1X2 = smd 1 x 1: 1 0,0
STAND-OFF = hole 3.302: 0,0
1X05_NO_SILK = drill 1.016 pad 1.88: 1 0,0; 2 2.54,0; 3 5.08,0; 4 7.62,0; 5 10.16,0
1X06-SMD_RA_MALE = smd 1 x 3: 1 -6.35,5; 2 -3.81,5; 3 -1.27,5; 4 1.27,5; 5 3.81,5; 6 6.35,5 | hole 1.4: -5.08,0; 5.08,0
JST04_1MM_RA = smd 0.6 x 1.35: 1 -1.5,0; 2 -0.5,0; 3 0.5,0; 4 1.5,0 | smd 1.2 x 2: NC1 2.8,-3.675; NC2 -2.8,-3.675
2X5-PTH-1.27MM-NO_SILK = drill 0.508 pad 1: 1 -2.54,-0.635; 2 -2.54,0.635; 3 -1.27,-0.635; 4 -1.27,0.635; 5 0,-0.635; 6 0,0.635; 7 1.27,-0.635; 8 1.27,0.635; 9 2.54,-0.635; 10 2.54,0.635
FPC-24-AMPHENOL-SFV24R-1STE1HLF = smd 0.3 x 1.4: 1 5.75,2.4; 2 5.25,2.4; 3 4.75,2.4; 4 4.25,2.4; 5 3.75,2.4; 6 3.25,2.4; 7 2.75,2.4; 8 2.25,2.4; 9 1.75,2.4; 10 1.25,2.4; 11 0.75,2.4; 12 0.25,2.4; 13 -0.25,2.4; 14 -0.75,2.4; 15 -1.25,2.4; 16 -1.75,2.4; 17 -2.25,2.4; 18 -2.75,2.4; 19 -3.25,2.4; 20 -3.75,2.4; 21 -4.25,2.4; 22 -4.75,2.4; 23 -5.25,2.4; 24 -5.75,2.4 | smd 1.4 x 1.6: MNT1@0 -8.15,1.5; MNT2@1 8.15,1.5 | smd 1.25 x 2.3: MNT1@1 -6.825,1.15; MNT2@0 6.825,1.15
TACTILE_SWITCH_SMD_5.2MM = smd 1.524 x 0.762: 1 -2.794,1.905; 2 2.794,1.905; 3 -2.794,-1.905; 4 2.794,-1.905
PAD.03X.05 = smd 1.27 x 1.27: P$1 0,0
LGA-12-LISDH12 = smd 0.275 x 0.25: 1 -0.75,0.75; 2 -0.75,0.25; 3 -0.75,-0.25; 4 -0.75,-0.75; 7 0.75,-0.75; 8 0.75,-0.25; 9 0.75,0.25; 10 0.75,0.75 | smd 0.25 x 0.275: 5 -0.25,-0.75; 6 0.25,-0.75; 11 0.25,0.75; 12 -0.25,0.75
SOT23-5 = smd 0.55 x 1.2: 1 -0.95,-1.3; 2 0,-1.3; 3 0.95,-1.3; 4 0.95,1.3; 5 -0.95,1.3
ARTEMIS_FP = smd 0.4 x 0.6: AD16 -4,-3.7; BOOT 1.5,4.5; D0 0.5,-4.5; D1 -0.5,-4.5; D2 -1,-3.7; D3 2,-3.7; D7 -1.5,4.5; D8 -0.5,4.5; D9 2,3.7; D10 1,3.7; D14 -5,3.7; D17 -3.5,-4.5; D36 2.5,-4.5; D38 3,-3.7; D40 2.5,4.5; D41 -2.5,-4.5; GND@1 4.5,4.5; GND@39 -5.5,-4.5; GND@47 -1.5,-4.5; GND@59 4.5,-4.5; RXI-0 3.5,4.5; SWDCK 4,3.7; SWDIO 0,3.7; TXO-0 0.5,4.5; ~AD31 -3,-3.7; ~AD35 -2,3.7; ~D4 -2.5,4.5; ~D5 -1,3.7; ~D18 -4.5,-4.5; ~D19 -5,-3.7; ~D22 -3.5,4.5; ~D23 -4,3.7; ~D24 -3,3.7; ~D27 -4.5,4.5; ~D28 -5.5,4.5; ~D37 3.5,-4.5; ~D39 3,3.7; ~D42 1.5,-4.5; ~D43 1,-3.7; ~D44 4,-3.7; ~D45 -2,-3.7; ~RST 0,-3.7 | smd 0.6 x 0.4: AD34 -6.5,-0.5; D15 -6.5,0.5; VDD@36 -5.7,-3; VDD@37 -6.5,-3.5; XI -6.5,-2.5; XO -5.7,-2; ~AD11 -5.7,-1; ~AD12 -5.7,2; ~AD13 -5.7,1; ~AD29 -6.5,-1.5; ~AD32 -5.7,3; ~AD33/SWO -5.7,0; ~D6 -6.5,3.5; ~D25 -6.5,2.5; ~D26 -6.5,1.5 | smd 0.6 x 0.6: GND@22 -6.5,4.5; GND@38 -6.5,-4.5
CRYSTAL-SMD-3.2X1.5MM = smd 1 x 1.8: P$1 -1.25,0; P$2 1.25,0

### Placement (x,y rotation side)
BT1  10.5,20 90 bottom
C1  8,5 180 top
C2  27.48,14.8 90 top
C4  24,13.5 180 top
C6  11,23 0 top
C7  11,26 0 top
C9  23,16 270 top
C10  23,18 90 top
C11  26.51,14.8 270 top
C17  11,20 180 top
C18  9,35 180 top
C20  22.5,11 270 top
C21  24,11 270 top
C22  28.5,30.5 270 top
C23  26.5,33 0 top
D1  11,16.5 180 top
D2  11,18.5 180 top
D3  15,4 270 top
D4  17,4 270 top
D5  21,4 270 top
D6  19,4 270 top
E1  8,37 270 top
E2  8,3 270 top
FD1  1,39 0 top
FD2  39,1 0 top
FD3  39,1 0 bottom
FD4  1,39 0 bottom
FRAME1  1,-13 0 top  (outside the outline)
FRAME2  1,-13 0 top  (outside the outline)
H1  2.83,37.17 0 top
H2  37.17,37.17 0 top
H3  37.17,2.83 0 top
H4  2.83,2.83 0 top
J1  22.86,3.81 0 top
J2  1.5,20 270 top
J3  22.86,1.27 0 top
J4  35,29 90 top
J5  31.75,31.21 270 top
J6  20,37 180 top
LOGO1  20,27.6 0 top
LOGO2  2.64,7 0 top
R5  15,7 90 top
R6  17,7 90 top
R7  21,7 90 top
R8  19,7 90 top
R10  17.2,31 270 top
R11  26.5,28 0 top
R12  16,12 180 top
R13  16,31 270 top
R14  16,10 180 top
R15  14.5,31 270 top
R22  19,31 90 top
R23  35,27 270 bottom
R24  35,31 90 bottom
R25  21,14 270 top
R26  19,14 270 top
R27  11,21.5 180 top
R28  11,27.5 0 top
R29  11,24.5 180 top
S3  5,31 180 top
TP1  34.29,35.56 0 bottom
TP2  31.75,35.56 0 bottom
TP3  38.1,30.23 0 bottom
TP4  38.1,27.69 0 bottom
TP5  3.81,33.02 0 bottom
TP6  3.81,30.48 0 bottom
TP7  19,33.1 0 bottom
U2  20,11 0 top
U3  26.5,30.5 0 top
U5  35,20 0 top
U$1  [MIC00]  5.92,39.24 0 top
U$2  [BLK2]  4.57,12.32 0 top
U$3  [GND0]  33.66,3.81 45 top
U$4  [VDD1]  22.86,4.83 90 top
U$5  [#453]  30.48,4.83 90 top
U$6  [#A312]  27.94,4.83 90 top
U$7  [A161]  25.4,4.83 90 top
U$8  [MIC10]  6,0.8 0 top
U$9  [VDD1]  22.86,4.83 90 bottom
U$10  [A161]  25.4,4.83 90 bottom
U$11  [#A312]  27.94,4.83 90 bottom
U$12  [#453]  30.48,4.83 90 bottom
U$13  [#444]  33.02,4.83 90 bottom
U$14  [GND0]  33.66,3.81 135 bottom
U$15  [EDGE_20]  16.89,25.65 0 top
U$16  [372]  21,-0.3 90 top
U$19  [QWIIC_COPYRIGHT_SMALL]  36.9,33.8 0 top
U$20  [CAMERA3]  28.45,38.35 0 top
U$21  [POWEREDBY_TF#JPG]  32.77,12.3 0 top
U$23  [171]  19,-0.1 90 top
U$25  [POWEREDBY_TF#JPG]  13.34,6.22 0 bottom
U$26  [182]  16.9,-0.1 90 top
U$27  [RST15]  2.7,34.5 0 top
U$28  [GRN1]  4.57,27.69 0 top
U$29  [SFE_LOGO_NAME_.1]  24.64,36 0 bottom
U$30  [OSHW-LOGO-S]  2.64,7 0 bottom
U$31  [193]  15,-0.1 90 top
U$32  [EDGE_20]  28.54,34 0 bottom
U$36  [#444]  33.02,4.83 90 top
Y2  25,17 270 top

### Tracks (layer width: path | path; a pad name or v marks a point on that pad's centre or on a via)
1.8V  (via drill 0.3)
  Top 0.152: U3.5 25.55,32.55 C23.1 v25.2,33 | J6.10 18.75,35.65 v19,35.9
  Bottom 0.152: v25.2,33 19.1,33 TP7.P$1 v19,35.9
!DTR
  Top 0.152: J2.1 8.55,26.35 8.9,26 C7.1 R29.2 C6.1
A16
  Top 0.152: J3.2 25.67,1.27 26.7,2.3 26.7,5 31,9.3 31,12.18 30.93,12.25 30.93,12.69 31,12.75 U5.AD16
ACCEL_I2C_SCL  (via drill 0.3)
  Top 0.152: U2.1 18.25,11.75 v18.2,11.8 18,12 R12.1 | U5.~D42 36.5,13.83 v36.53,13.8
  Bottom 0.152: v36.53,13.8 35.8,13.8 35.3,13.3 19.7,13.3 v18.2,11.8
ACCEL_I2C_SDA  (via drill 0.3)
  Top 0.152: U2.4 18.25,10.25 v18.1,10.1 18,10 R14.1 | U5.~D43 36,13.03 v35.97,13
  Bottom 0.152: v35.97,13 21,13 v18.1,10.1
ACCEL_INT1
  Top 0.152: U2.12 19.75,12.35 19,13.1 R26.2
ACCEL_INT2
  Top 0.152: U2.11 20.25,12.05 21.1,12.9 21.1,13.4 R25.2
AMBIQ_!RST  (via drill 0.3)
  Top 0.152: C17.1 R27.1 11.85,22.95 11.8,23 | v16,22 15,23 C6.2 11.8,23 | v34.95,21.95 35,21.89 U5.~RST | S3.3 9.49,32.91 11,31.4 11,23.15 11.15,23 11.8,23
  Bottom 0.152: J5.10 32.4,28.66 32.4,25.88 34.54,23.74 36.42,23.74 37.43,22.72 37.43,21.78 37.12,21.47 36.68,21.47 36.2,21.95 v34.95,21.95 34.6,22.29 16.29,22.29 v16,22
BOOT  (via drill 0.3)
  Top 0.152: R28.2 C7.2 v15.5,26 | U5.BOOT v36.5,22.9
  Bottom 0.152: v36.5,22.9 35.97,23.43 35.28,23.43 35.05,23.2 18.3,23.2 v15.5,26
CAMERA_DVDD_EN
  Top 0.152: U5.D7 33.5,25.12 30.62,28 27.4,28 | 27.4,28 R11.2 | U3.3 27.45,28.05 27.4,28
CAMERA_HREF
  Top 0.152: J6.9 18.25,33.17 19.53,31.89 19.53,22.47 21,21 26.27,21 26.35,20.92 27.05,20.92 27.13,21 U5.~AD13
CAMERA_I2C_SCL  (via drill 0.3)
  Top 0.152: U5.~D27 30.5,25.3 29.89,25.91 25.53,25.91 v25.3,25.68 | J6.5 16.25,33.17 | R13.1 16,32.9 16.25,33.15 16.25,33.17 | v16.22,33.2 16.25,33.17
  Bottom 0.152: v25.3,25.68 19.32,25.68 16,29 16,32.98 v16.22,33.2
CAMERA_I2C_SDA  (via drill 0.3)
  Top 0.152: U5.~D25 21.5,22.5 20.61,23.39 v20.61,23.74 | J6.3 15.25,33.55 v14.95,33.25 14.5,32.8 R15.1
  Bottom 0.152: v20.61,23.74 19.26,23.74 14.95,28.05 v14.95,33.25
CAMERA_PCLK
  Top 0.152: J6.17 22.25,27.68 24.78,25.15 25.52,25.15 25.98,25.61 29.23,25.61 30,24.83 U5.D14
CAMERA_PWDN
  Top 0.152: U5.D15 21,20.5 18.43,23.07 18.43,29.73 18.43,31.5 | J6.8 17.75,32.6 18.43,31.92 18.43,31.5 | R22.2 18.43,31.5
CAMERA_RESET
  Top 0.152: U5.~AD11 27.13,19 26.73,19.41 21.09,19.41 17.72,22.78 17.72,23.1 17.73,23.1 17.73,31.5 | J6.6 16.75,32.74 17.73,31.76 17.73,31.5 | R10.1 17.73,31.5
CAMERA_VSYNC
  Top 0.152: U5.AD34 27.06,19.5 26.85,19.71 21.29,19.71 18.03,22.97 18.03,31.89 17.25,32.67 J6.7
CAMERA_XCLK
  Top 0.152: U5.~AD32 22.1,23 20.25,24.85 J6.13
CAMERA_Y0
  Top 0.152: U5.~D22 31.5,25.4 30.38,26.52 24.41,26.52 23.25,27.68 J6.19
CAMERA_Y1
  Top 0.152: U5.~D4 32.5,25.26 30.63,27.13 24.92,27.13 24.25,27.8 J6.21
CAMERA_Y2
  Top 0.152: U5.~AD35 33,25.19 30.76,27.43 25.37,27.43 24.85,27.95 24.75,28.05 24.75,32.7 24.67,32.78 24.67,33.22 24.75,33.3 J6.22
CAMERA_Y3
  Top 0.152: U5.~D24 32,25.33 30.51,26.82 24.68,26.82 23.75,27.75 J6.20
CAMERA_Y4
  Top 0.152: U5.~D23 31,25.23 30.02,26.21 24.29,26.21 22.75,27.75 J6.18
CAMERA_Y5
  Top 0.152: U5.~D28 29.5,24.9 29.2,25.2 26,25.2 25.65,24.84 24.56,24.84 21.75,27.65 21.75,32.05 21.78,32.08 21.78,32.52 21.75,32.55 J6.16
CAMERA_Y6
  Top 0.152: U5.~D6 23.4,23.5 20.72,26.18 20.72,32.52 20.75,32.55 J6.14
CAMERA_Y7
  Top 0.152: J6.12 19.75,32.1 19.83,32.02 19.83,22.6 20.93,21.5 26.2,21.5 26.48,21.22 26.92,21.22 27.2,21.5 U5.~D26
FTDI_VCC
  Top 0.152: J2.4 8.77,18.73 9,18.5 D2.A
GND  (via drill 0.3)
  Top 0.152: 34.3,26.8 v34.03,26.8 | J6.2 v14.75,36 | v21.25,36.1 J6.15 v21.25,32.3 | 6.37,3.02 E2.3 5.25,3 v5.21,3.05 | 6.37,3.02 6.37,3.26 6.74,3.63 6.98,3.63 E2.6 7.02,3.63 7.26,3.63 7.63,3.26 7.63,3.02 E2.8 7.63,2.98 7.63,2.74 7.26,2.37 7.02,2.37 E2.7 6.98,2.37 6.74,2.37 6.37,2.74 6.37,3.02 | E1.6 6.98,37.63 6.74,37.63 6.37,37.26 6.37,37.02 E1.3 6.37,36.98 6.37,36.74 6.74,36.37 6.98,36.37 E1.7 7.02,36.37 7.26,36.37 7.63,36.74 7.63,36.98 E1.8 7.63,37.02 7.63,37.26 7.26,37.63 7.02,37.63 E1.6 | E1.6 7,38.35 | U3.2 26.5,28.5 R11.1
  other vias: 13.59,3.05 6.48,14.86 8.76,12.7 21.97,17.02 28.45,14.48 33.66,14.35 33.53,17.14 39.37,22.86 39.37,17.14 39.37,14.48 28.45,28.96 28.07,33.02 7.49,34.8 9.27,28.7 14.86,24.51 21.72,9.78 25.27,10.41 21.59,12.32 18.96,29.51 29.45,14.48 27.55,24.28
  pour Bottom (isolate 0.152): 0,40 0,0 40,0 40,40
  pour Top (isolate 0.152): 0,40 40,40 40,0 0,0
LED_BLUE
  Top 0.152: U5.~D18 30.5,14.07 25.33,8.89 17.4,8.89 17,8.49 R6.2
LED_GREEN  (via drill 0.3)
  Top 0.152: U5.D17 31.5,12.5 v31.47,12.47 | v18,7.8 18.05,7.85 R8.2
  Bottom 0.152: v31.47,12.47 22.67,12.47 v18,7.8
LED_RED
  Top 0.152: U5.~D19 30,14 25.2,9.2 15.6,9.2 15,8.6 R5.2
LED_YELLOW  (via drill 0.3)
  Top 0.152: U5.~D37 38.5,14.7 v35.9,12.1 | v20,7.8 20.05,7.85 R7.2
  Bottom 0.152: v35.9,12.1 31.85,12.1 31.69,11.93 31.25,11.93 31.08,12.1 23.2,12.1 20,8.9 v20,7.8
MIC_CLK  (via drill 0.3)
  Top 0.152: E2.4 8.3,1.4 8.7,1 v11,1 | v26.7,21.76 26.94,22 U5.~AD12 | E1.4 8.3,36.7 8.6,37 9.77,37 10.1,37.33 v10.1,39
  Bottom 0.152: v26.7,21.76 26.47,21.99 17.79,21.99 16.3,20.5 16.3,19.45 16.53,19.22 16.53,18.78 16.3,18.55 16.3,8.51 13.2,5.4 11,5.4 | v10.1,39 6.05,39 5.62,39.43 5.18,39.43 4.87,39.12 4.87,38.68 5.09,38.45 5.09,36.13 2.1,33.13 2.1,28.17 4,26.27 4,8.07 6.37,5.7 10.71,5.7 11,5.4 | v11,1 11,5.4
MIC_DATA  (via drill 0.3)
  Top 0.152: U5.~AD29 27.2,18.5 26.6,19.1 16.1,19.1 v16,19 | E2.1 10.9,3.9 v13,6 | E1.1 9.3,38.5 8.9,38.9 v5.4,38.9
  Bottom 0.152: v16,19 16,9 v13,6 6.5,6 4.3,8.2 4.3,26.4 2.4,28.3 2.4,33 5.4,36 v5.4,38.9
N$2
  Top 0.152: U5.XI 26.23,17.5 25,16.27 Y2.P$2 24.75,15.5 C9.2
N$5
  Top 0.152: R6.1 D4.A
N$6
  Top 0.152: R5.1 D3.A
N$7
  Top 0.152: R7.1 D5.A
N$8
  Top 0.152: R8.1 D6.A
QWIIC_SCL  (via drill 0.3)
  Top 0.152: J4.4 36.43,30.5 v36.7,30.23 36.77,30.23 37.3,29.7 37.3,25.53 38,24.83 U5.~D39
  Bottom 0.152: R24.1 35.08,30.23 v36.7,30.23 TP3.P$1
QWIIC_SDA  (via drill 0.3)
  Top 0.152: J4.3 36,29.5 36.7,28.8 v36.7,27.85 36.7,25.7 37.5,24.9 U5.D40
  Bottom 0.152: R23.1 v36.7,27.85 37.94,27.85 TP4.P$1
SWDCK  (via drill 0.3)
  Top 0.152: U5.SWDCK 39,23.24 38.84,23.08 38.84,22.64 39,22.48 v39,22
  Bottom 0.152: v39,22 39,22.48 38.84,22.64 38.84,23.08 39,23.24 39,25.77 39.6,26.37 39.6,30.83 37.41,33.02 34.29,33.02 | J5.4 32.92,33.02 34.29,33.02 | TP1.P$1 34.29,33.02
SWDIO
  Top 0.152: U5.SWDIO 35,25 33.4,26.6 33.4,33 32.65,33.75 J5.2
  Bottom 0.152: J5.2 31.75,34.38 TP2.P$1
UART-RX  (via drill 0.3)
  Top 0.152: U5.RXI-0 38.5,23.3 37.2,22 v36.9,22 | J2.3 5.9,21.87 v5.9,22.5
  Bottom 0.152: v36.9,22 36.53,22.37 35.28,22.37 35.05,22.59 17.67,22.59 14.29,25.97 14.29,27.7 12.52,29.48 6.35,29.48 5.9,29.48 | v5.9,22.5 5.9,29.21 5.9,29.48 | 5.9,29.48 4.81,29.48 TP6.P$1
UART-TX  (via drill 0.3)
  Top 0.152: U5.TXO-0 v35.5,22.9 | J2.2 5.79,23.81 5.1,24.5 v5.1,25.2
  Bottom 0.152: v35.5,22.9 17.8,22.9 14.6,26.1 14.6,28 12.8,29.8 6.2,29.8 4.62,31.38 2.8,31.38 | v5.1,25.2 4.61,25.7 4.61,26.53 2.8,28.33 2.8,31.38 | TP5.P$1 2.8,32.01 2.8,31.38
V_BATT  (via drill 0.3)
  Top 0.152: v10,12.2 9.85,12.35 D1.A
  Bottom 0.152: BT1.1 12.05,10.15 v10,12.2
VDD  (via drill 0.3)
  Top 0.152: J4.2 v36.17,28.5 | U3.1 25.55,30.15 25.9,30.5 28,30.5 C22.1 28.5,32.3 29.95,33.75 J5.1 31.11,35 | R27.2 10.62,21.5 10.93,21.2 10.93,18.87 11.3,18.5 D2.C 13.7,18.5 16.53,21.33 16.53,27.87 16,28.4 R13.2 | 20.75,11.5 U2.9 U2.2 19.25,11 | 20.75,11.5 U2.10 | U2.3 19.25,11 | 15.15,11 R12.2 15.15,14.43 15.22,14.5 | 15.15,11 R14.2 10,10 8.5,8.5 C1.1 8.5,4.5 8.3,4.3 E2.2 8.3,3.5 9.3,2.5 E2.5 | 20.75,11.5 C20.1 22.85,11.85 C21.1 24.85,12.7 C4.1 | J6.11 19.25,35.4 19.53,35.68 19.53,37.47 19.5,37.5 | 31.11,35 31.11,36.48 30.1,37.5 19.5,37.5 | 15.8,37.5 10.7,37.5 E1.5 9.3,35.6 9.5,35.4 C18.1 9.5,34.1 13.45,30.15 R15.2 R13.2 | 15.8,37.5 19.5,37.5 | J6.4 15.75,37.45 15.8,37.5 | v34,31.85 34,34.2 33.2,35 31.11,35 | 15.15,11 19.25,11 | R10.2 16.85,30.15 R13.2
  Top 0.305: D2.C D1.C 13.22,16.5 15.22,14.5 v17.14,14.5 R26.1 R25.1 24.9,14.5 | 24.9,14.5 25.3,14.5 25.75,14.95 26.03,14.95 26.38,15.3 C11.1 C2.2 27.48,15.9 28.09,16.51 U5.VDD@37 28.63,16.5 29.13,17 U5.VDD@36 | C4.1 24.85,14.45 24.9,14.5
  Bottom 0.152: v36.17,28.5 36.67,29 39.3,29 | 39.3,29 39.3,30.7 38.15,31.85 R24.2 v34,31.85 | R23.2 38.95,26.15 39.3,26.5 39.3,29
  Bottom 0.305: J3.1 19.05,1.27 16.51,3.81 16.51,8.17 16.69,8.35 16.69,14.04 v17.14,14.5
X0
  Top 0.152: U5.XO 26.4,18 26.1,18.3 25.05,18.3 Y2.P$1 23.95,18.25 23.7,18.5 C10.2
~44
  Top 0.152: J3.5 33.27,1.27 35,3 35,8 39,12 39,14.09 38.84,14.26 38.84,14.7 39,14.86 U5.~D44
~45
  Top 0.152: U5.~D45 33,7 31.8,5.8 31.8,2.59 J3.4
~A31
  Top 0.152: U5.~AD31 32,7.5 29.3,4.8 29.3,2.63 J3.3
~AD33/SWO  (via drill 0.3)
  Top 0.152: U5.~AD33/SWO v30.4,20
  Bottom 0.152: v30.4,20 30.5,20 31.66,21.16 37.25,21.16 37.74,21.65 37.74,22.85 36.54,24.04 34.9,24.04 33.4,25.54 33.4,30.2 J5.6

### Text on the board
Bottom: v20
tDocu: Jim Lindblom